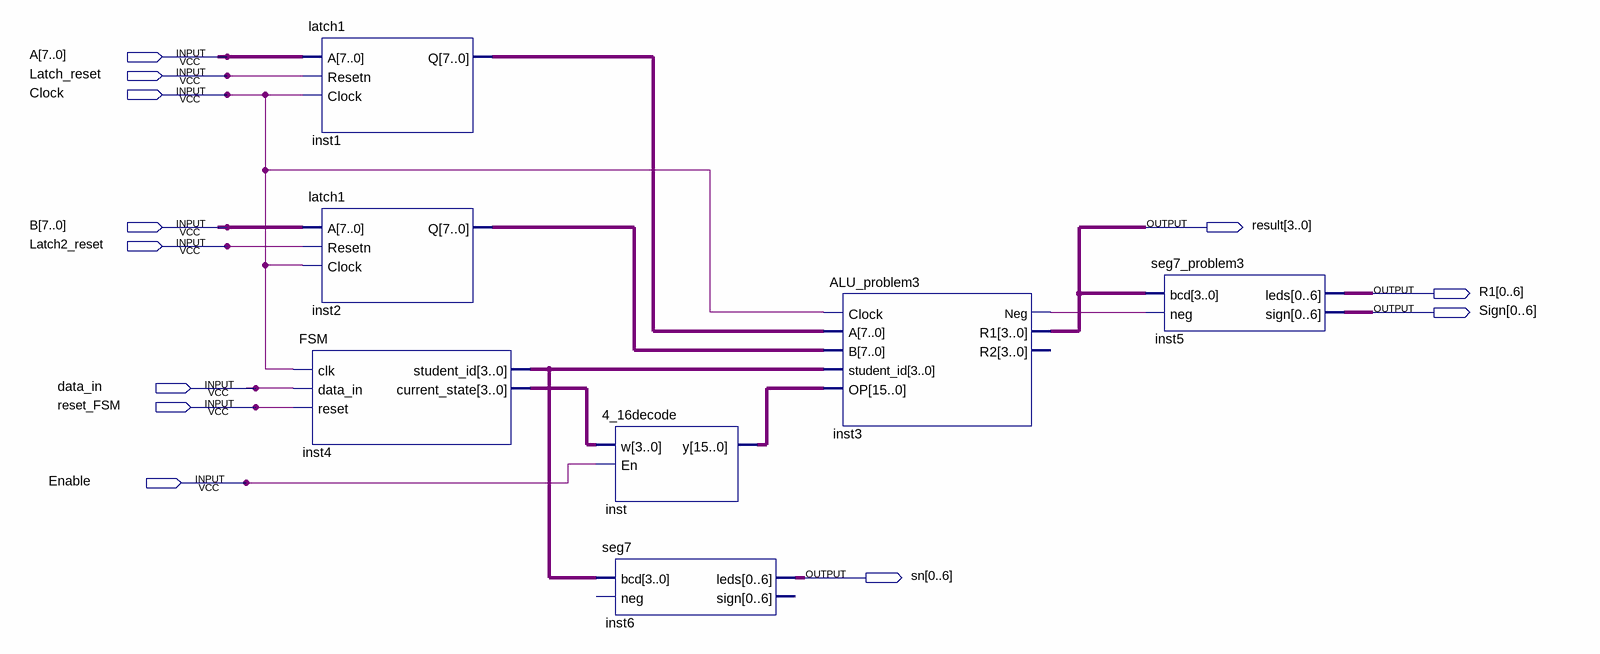
[diagram p0: schematic sheet]
// Quartus schematic problem3.bdf as structural Verilog: 7 symbols, 12 pins
module problem3 (
  input  [7:0] A,
  input  Latch_reset,
  input  Clock,
  input  [7:0] B,
  input  Latch2_reset,
  input  data_in,
  input  reset_FSM,
  input  Enable,
  output [3:0] result,
  output [0:6] R1,
  output [0:6] Sign,
  output [0:6] sn
);

  wire inst3_neg;
  wire [3:0] inst4_current_state, inst4_student_id;
  wire [7:0] inst1_q, inst2_q;
  wire [15:0] inst_y;

  latch1 inst1 (.A(A), .Resetn(Latch_reset), .Clock(Clock), .Q(inst1_q));
  latch1 inst2 (.A(B), .Resetn(Latch2_reset), .Clock(Clock), .Q(inst2_q));
  FSM inst4 (
    .clk(Clock), .data_in(data_in), .reset(reset_FSM), .student_id(inst4_student_id),
    .current_state(inst4_current_state));
  \4_16decode  inst (.w(inst4_current_state), .En(Enable), .y(inst_y));
  seg7 inst6 (.bcd(inst4_student_id), .leds(sn));  // open: neg, sign
  ALU_problem3 inst3 (
    .Clock(Clock), .A(inst1_q), .B(inst2_q), .student_id(inst4_student_id), .OP(inst_y), .Neg(inst3_neg),
    .R1(result));  // open: R2
  seg7_problem3 inst5 (.bcd(result), .neg(inst3_neg), .leds(R1), .sign(Sign));
endmodule
